# Altium schematic sheet FR3068E-C_MCU_DEV1.4.SchDoc
size A3; SheetNumber: 1; SheetTotal: 3
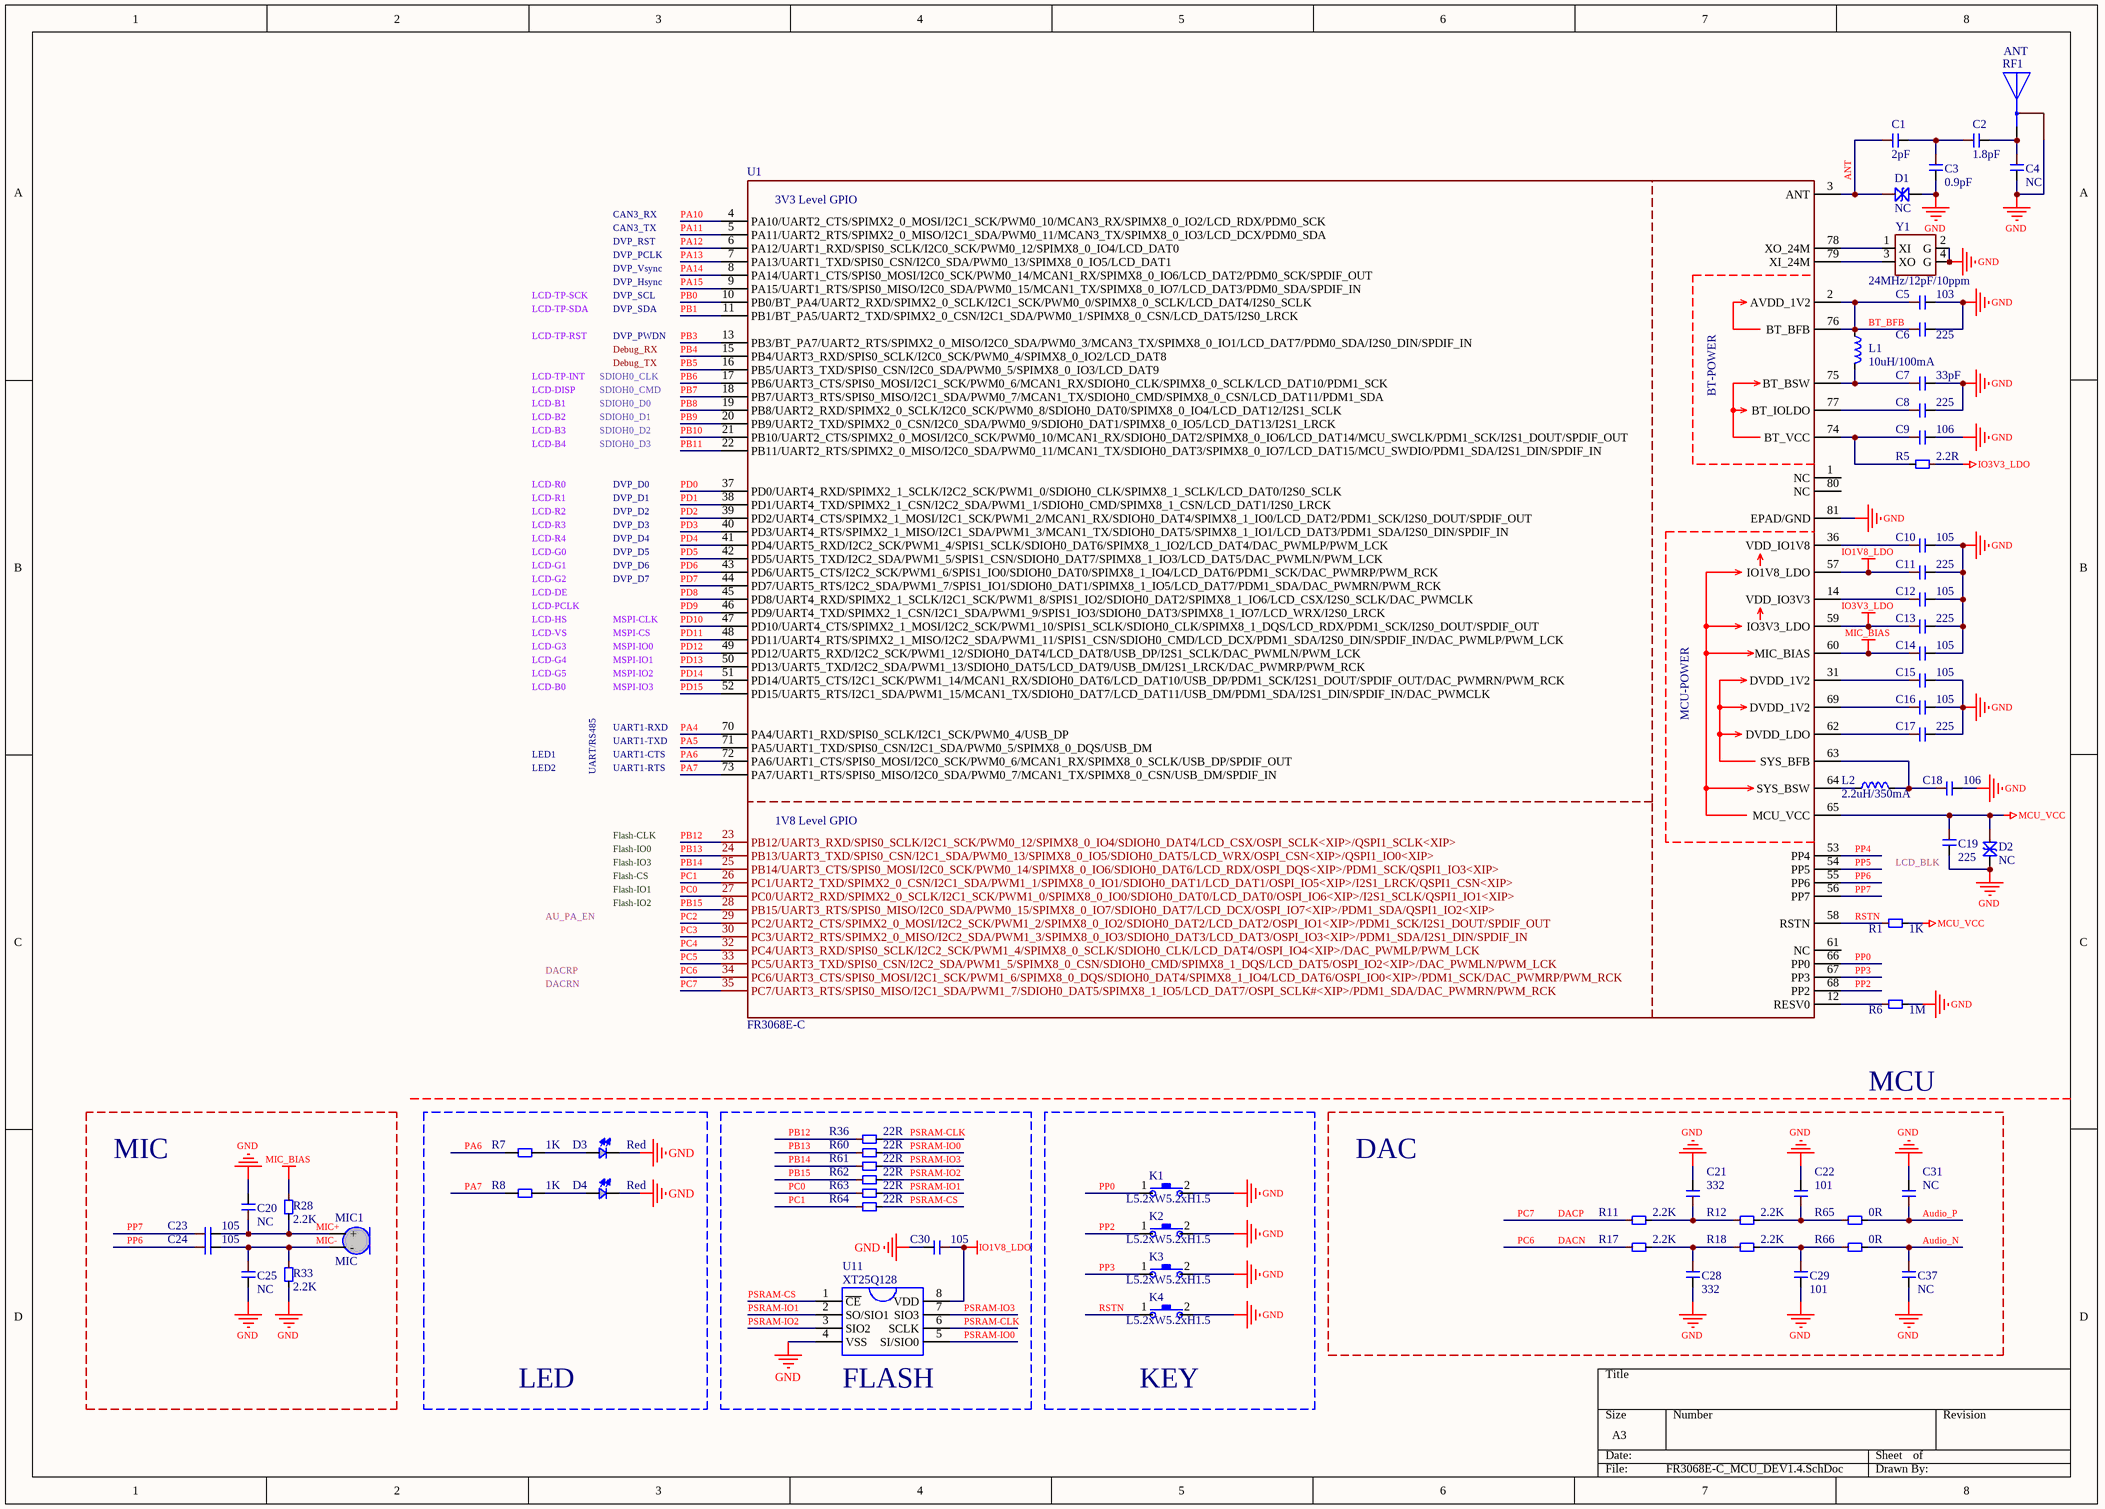
[diagram p0: FR3068E-C_MCU_DEV1.4.SchDoc]

## Parts
C1  2pF  [C0402]
C2  1.8pF  [C0402]
C3  0.9pF  [C0402]
C4  NC  [C0402]
C5  103  [C0402]
C6  225  [C0402]
C7  33pF  [C0402]
C8  225  [C0402]
C9  106  [C0603]
C10  105  [C0402]
C11  225  [C0402]
C12  105  [C0402]
C13  225  [C0402]
C14  105  [C0402]
C15  105  [C0402]
C16  105  [C0402]
C17  225  [C0402]
C18  106  [C0603]
C19  225  [C0402]
C20  NC  [C0402]
C21  332  [C0402]
C22  101  [C0402]
C23  105  [C0402]
C24  105  [C0402]
C25  NC  [C0402]
C28  332  [C0402]
C29  101  [C0402]
C30  105  [C0402]
C31  NC  [C0402]
C37  NC  [C0402]
D1  NC  [R0402]
D2  NC  [SOD-323A]
D3  Red  [D0603]
D4  Red  [D0603]
K1  L5.2xW5.2xH1.5  [TS-030 5.2*5.2mm]
K2  L5.2xW5.2xH1.5  [TS-030 5.2*5.2mm]
K3  L5.2xW5.2xH1.5  [TS-030 5.2*5.2mm]
K4  L5.2xW5.2xH1.5  [TS-030 5.2*5.2mm]
L1  10uH/100mA  [L0603]
L2  2.2uH/350mA  [L0603]
MIC1  MIC  [MIC4013SMT]
R1  1K  [R0402]
R5  2.2R  [R0603]
R6  1M  [R0402]
R7  1K  [R0402]
R8  1K  [R0402]
R11  2.2K  [R0402]
R12  2.2K  [R0402]
R17  2.2K  [R0402]
R18  2.2K  [R0402]
R28  2.2K  [R0402]
R33  2.2K  [R0402]
R36  22R  [R0402]
R60  22R  [R0402]
R61  22R  [R0402]
R62  22R  [R0402]
R63  22R  [R0402]
R64  22R  [R0402]
R65  0R  [R0402]
R66  0R  [R0402]
RF1  ANT  [RFA]
U1  FR3068E-C  [QFN80_0909_P0.4]
U11  XT25Q128  [WSON8_6X5MM]
Y1  24MHz/12pF/10ppm  [CRY3225_4P]

## Blocks framed on the sheet
MIC: C20 C23-C25 MIC1 R28 R33
LED: D3 D4 R7 R8
FLASH: C30 R36 R60-R64 U11
KEY: K1-K4

## Nets
GND: C3.1 C4.1 C5.1 C6.1 C7.1 C8.1 C9.1 C10.1 C11.1 C12.1 C13.1 C14.1 C15.1 C16.1 C17.1 C18.1 C19.1 C20.1 C21.1 C22.1 C25.1 C28.1 C29.1 C30.1 C31.1 C37.1 D1.1 D2.1 D3.2 D4.2 K1.2 K2.2 K3.2 K4.2 R6.1 R33.1 RF1.2 U1.81(EPAD/GND) U11.4(VSS) Y1.2(G) Y1.4(G)
IO1V8_LDO: C11.2 C30.2 U1.57(IO1V8_LDO) U11.8(VDD)
IO3V3_LDO: C13.2 R5.2 U1.59(IO3V3_LDO)
MCU_VCC: C19.2 D2.2 R1.1 U1.65(MCU_VCC)
MIC_BIAS: C14.2 R28.2 U1.60(MIC_BIAS)
ANT: C1.2 D1.2 U1.3(ANT)
Audio_N: C37.2 R66.1
Audio_P: C31.2 R65.1
BT_BFB: C5.2 C6.2 L1.1 U1.2(AVDD_1V2) U1.76(BT_BFB)
DACN: R17.2 U1.34(PC6/UART3_CTS/SPIS0_MOSI/I2C1_SCK/PWM1_6/SPIMX8_0_DQS/SDIOH0_DAT4/SPIMX8_1_IO4/LCD_DAT6/OSPI_IO0<XIP>/PDM1_SCK/DAC_PWMRP/PWM_RCK)  [also labelled PC6]
DACP: R11.2 U1.35(PC7/UART3_RTS/SPIS0_MISO/I2C1_SDA/PWM1_7/SDIOH0_DAT5/SPIMX8_1_IO5/LCD_DAT7/OSPI_SCLK#<XIP>/PDM1_SDA/DAC_PWMRN/PWM_RCK)  [also labelled PC7]
MIC+: C20.2 C23.1 MIC1.1(+) R28.1
MIC-: C24.1 C25.2 MIC1.2(-) R33.2
PA4: U1.70(PA4/UART1_RXD/SPIS0_SCLK/I2C1_SCK/PWM0_4/USB_DP)
PA5: U1.71(PA5/UART1_TXD/SPIS0_CSN/I2C1_SDA/PWM0_5/SPIMX8_0_DQS/USB_DM)
PA6: R7.2 U1.72(PA6/UART1_CTS/SPIS0_MOSI/I2C0_SCK/PWM0_6/MCAN1_RX/SPIMX8_0_SCLK/USB_DP/SPDIF_OUT)
PA7: R8.2 U1.73(PA7/UART1_RTS/SPIS0_MISO/I2C0_SDA/PWM0_7/MCAN1_TX/SPIMX8_0_CSN/USB_DM/SPDIF_IN)
PA10: U1.4(PA10/UART2_CTS/SPIMX2_0_MOSI/I2C1_SCK/PWM0_10/MCAN3_RX/SPIMX8_0_IO2/LCD_RDX/PDM0_SCK)
PA11: U1.5(PA11/UART2_RTS/SPIMX2_0_MISO/I2C1_SDA/PWM0_11/MCAN3_TX/SPIMX8_0_IO3/LCD_DCX/PDM0_SDA)
PA12: U1.6(PA12/UART1_RXD/SPIS0_SCLK/I2C0_SCK/PWM0_12/SPIMX8_0_IO4/LCD_DAT0)
PA13: U1.7(PA13/UART1_TXD/SPIS0_CSN/I2C0_SDA/PWM0_13/SPIMX8_0_IO5/LCD_DAT1)
PA14: U1.8(PA14/UART1_CTS/SPIS0_MOSI/I2C0_SCK/PWM0_14/MCAN1_RX/SPIMX8_0_IO6/LCD_DAT2/PDM0_SCK/SPDIF_OUT)
PA15: U1.9(PA15/UART1_RTS/SPIS0_MISO/I2C0_SDA/PWM0_15/MCAN1_TX/SPIMX8_0_IO7/LCD_DAT3/PDM0_SDA/SPDIF_IN)
PB0: U1.10(PB0/BT_PA4/UART2_RXD/SPIMX2_0_SCLK/I2C1_SCK/PWM0_0/SPIMX8_0_SCLK/LCD_DAT4/I2S0_SCLK)
PB1: U1.11(PB1/BT_PA5/UART2_TXD/SPIMX2_0_CSN/I2C1_SDA/PWM0_1/SPIMX8_0_CSN/LCD_DAT5/I2S0_LRCK)
PB3: U1.13(PB3/BT_PA7/UART2_RTS/SPIMX2_0_MISO/I2C0_SDA/PWM0_3/MCAN3_TX/SPIMX8_0_IO1/LCD_DAT7/PDM0_SDA/I2S0_DIN/SPDIF_IN)
PB4: U1.15(PB4/UART3_RXD/SPIS0_SCLK/I2C0_SCK/PWM0_4/SPIMX8_0_IO2/LCD_DAT8)
PB5: U1.16(PB5/UART3_TXD/SPIS0_CSN/I2C0_SDA/PWM0_5/SPIMX8_0_IO3/LCD_DAT9)
PB6: U1.17(PB6/UART3_CTS/SPIS0_MOSI/I2C1_SCK/PWM0_6/MCAN1_RX/SDIOH0_CLK/SPIMX8_0_SCLK/LCD_DAT10/PDM1_SCK)
PB7: U1.18(PB7/UART3_RTS/SPIS0_MISO/I2C1_SDA/PWM0_7/MCAN1_TX/SDIOH0_CMD/SPIMX8_0_CSN/LCD_DAT11/PDM1_SDA)
PB8: U1.19(PB8/UART2_RXD/SPIMX2_0_SCLK/I2C0_SCK/PWM0_8/SDIOH0_DAT0/SPIMX8_0_IO4/LCD_DAT12/I2S1_SCLK)
PB9: U1.20(PB9/UART2_TXD/SPIMX2_0_CSN/I2C0_SDA/PWM0_9/SDIOH0_DAT1/SPIMX8_0_IO5/LCD_DAT13/I2S1_LRCK)
PB10: U1.21(PB10/UART2_CTS/SPIMX2_0_MOSI/I2C0_SCK/PWM0_10/MCAN1_RX/SDIOH0_DAT2/SPIMX8_0_IO6/LCD_DAT14/MCU_SWCLK/PDM1_SCK/I2S1_DOUT/SPDIF_OUT)
PB11: U1.22(PB11/UART2_RTS/SPIMX2_0_MISO/I2C0_SDA/PWM0_11/MCAN1_TX/SDIOH0_DAT3/SPIMX8_0_IO7/LCD_DAT15/MCU_SWDIO/PDM1_SDA/I2S1_DIN/SPDIF_IN)
PB12: R36.2 U1.23(PB12/UART3_RXD/SPIS0_SCLK/I2C1_SCK/PWM0_12/SPIMX8_0_IO4/SDIOH0_DAT4/LCD_CSX/OSPI_SCLK<XIP>/QSPI1_SCLK<XIP>)
PB13: R60.2 U1.24(PB13/UART3_TXD/SPIS0_CSN/I2C1_SDA/PWM0_13/SPIMX8_0_IO5/SDIOH0_DAT5/LCD_WRX/OSPI_CSN<XIP>/QSPI1_IO0<XIP>)
PB14: R61.2 U1.25(PB14/UART3_CTS/SPIS0_MOSI/I2C0_SCK/PWM0_14/SPIMX8_0_IO6/SDIOH0_DAT6/LCD_RDX/OSPI_DQS<XIP>/PDM1_SCK/QSPI1_IO3<XIP>)
PB15: R62.2 U1.28(PB15/UART3_RTS/SPIS0_MISO/I2C0_SDA/PWM0_15/SPIMX8_0_IO7/SDIOH0_DAT7/LCD_DCX/OSPI_IO7<XIP>/PDM1_SDA/QSPI1_IO2<XIP>)
PC0: R63.2 U1.27(PC0/UART2_RXD/SPIMX2_0_SCLK/I2C1_SCK/PWM1_0/SPIMX8_0_IO0/SDIOH0_DAT0/LCD_DAT0/OSPI_IO6<XIP>/I2S1_SCLK/QSPI1_IO1<XIP>)
PC1: R64.2 U1.26(PC1/UART2_TXD/SPIMX2_0_CSN/I2C1_SDA/PWM1_1/SPIMX8_0_IO1/SDIOH0_DAT1/LCD_DAT1/OSPI_IO5<XIP>/I2S1_LRCK/QSPI1_CSN<XIP>)
PC2: U1.29(PC2/UART2_CTS/SPIMX2_0_MOSI/I2C2_SCK/PWM1_2/SPIMX8_0_IO2/SDIOH0_DAT2/LCD_DAT2/OSPI_IO1<XIP>/PDM1_SCK/I2S1_DOUT/SPDIF_OUT)
PC3: U1.30(PC3/UART2_RTS/SPIMX2_0_MISO/I2C2_SDA/PWM1_3/SPIMX8_0_IO3/SDIOH0_DAT3/LCD_DAT3/OSPI_IO3<XIP>/PDM1_SDA/I2S1_DIN/SPDIF_IN)
PC4: U1.32(PC4/UART3_RXD/SPIS0_SCLK/I2C2_SCK/PWM1_4/SPIMX8_0_SCLK/SDIOH0_CLK/LCD_DAT4/OSPI_IO4<XIP>/DAC_PWMLP/PWM_LCK)
PC5: U1.33(PC5/UART3_TXD/SPIS0_CSN/I2C2_SDA/PWM1_5/SPIMX8_0_CSN/SDIOH0_CMD/SPIMX8_1_DQS/LCD_DAT5/OSPI_IO2<XIP>/DAC_PWMLN/PWM_LCK)
PD0: U1.37(PD0/UART4_RXD/SPIMX2_1_SCLK/I2C2_SCK/PWM1_0/SDIOH0_CLK/SPIMX8_1_SCLK/LCD_DAT0/I2S0_SCLK)
PD1: U1.38(PD1/UART4_TXD/SPIMX2_1_CSN/I2C2_SDA/PWM1_1/SDIOH0_CMD/SPIMX8_1_CSN/LCD_DAT1/I2S0_LRCK)
PD2: U1.39(PD2/UART4_CTS/SPIMX2_1_MOSI/I2C1_SCK/PWM1_2/MCAN1_RX/SDIOH0_DAT4/SPIMX8_1_IO0/LCD_DAT2/PDM1_SCK/I2S0_DOUT/SPDIF_OUT)
PD3: U1.40(PD3/UART4_RTS/SPIMX2_1_MISO/I2C1_SDA/PWM1_3/MCAN1_TX/SDIOH0_DAT5/SPIMX8_1_IO1/LCD_DAT3/PDM1_SDA/I2S0_DIN/SPDIF_IN)
PD4: U1.41(PD4/UART5_RXD/I2C2_SCK/PWM1_4/SPIS1_SCLK/SDIOH0_DAT6/SPIMX8_1_IO2/LCD_DAT4/DAC_PWMLP/PWM_LCK)
PD5: U1.42(PD5/UART5_TXD/I2C2_SDA/PWM1_5/SPIS1_CSN/SDIOH0_DAT7/SPIMX8_1_IO3/LCD_DAT5/DAC_PWMLN/PWM_LCK)
PD6: U1.43(PD6/UART5_CTS/I2C2_SCK/PWM1_6/SPIS1_IO0/SDIOH0_DAT0/SPIMX8_1_IO4/LCD_DAT6/PDM1_SCK/DAC_PWMRP/PWM_RCK)
PD7: U1.44(PD7/UART5_RTS/I2C2_SDA/PWM1_7/SPIS1_IO1/SDIOH0_DAT1/SPIMX8_1_IO5/LCD_DAT7/PDM1_SDA/DAC_PWMRN/PWM_RCK)
PD8: U1.45(PD8/UART4_RXD/SPIMX2_1_SCLK/I2C1_SCK/PWM1_8/SPIS1_IO2/SDIOH0_DAT2/SPIMX8_1_IO6/LCD_CSX/I2S0_SCLK/DAC_PWMCLK)
PD9: U1.46(PD9/UART4_TXD/SPIMX2_1_CSN/I2C1_SDA/PWM1_9/SPIS1_IO3/SDIOH0_DAT3/SPIMX8_1_IO7/LCD_WRX/I2S0_LRCK)
PD10: U1.47(PD10/UART4_CTS/SPIMX2_1_MOSI/I2C2_SCK/PWM1_10/SPIS1_SCLK/SDIOH0_CLK/SPIMX8_1_DQS/LCD_RDX/PDM1_SCK/I2S0_DOUT/SPDIF_OUT)
PD11: U1.48(PD11/UART4_RTS/SPIMX2_1_MISO/I2C2_SDA/PWM1_11/SPIS1_CSN/SDIOH0_CMD/LCD_DCX/PDM1_SDA/I2S0_DIN/SPDIF_IN/DAC_PWMLP/PWM_LCK)
PD12: U1.49(PD12/UART5_RXD/I2C2_SCK/PWM1_12/SDIOH0_DAT4/LCD_DAT8/USB_DP/I2S1_SCLK/DAC_PWMLN/PWM_LCK)
PD13: U1.50(PD13/UART5_TXD/I2C2_SDA/PWM1_13/SDIOH0_DAT5/LCD_DAT9/USB_DM/I2S1_LRCK/DAC_PWMRP/PWM_RCK)
PD14: U1.51(PD14/UART5_CTS/I2C1_SCK/PWM1_14/MCAN1_RX/SDIOH0_DAT6/LCD_DAT10/USB_DP/PDM1_SCK/I2S1_DOUT/SPDIF_OUT/DAC_PWMRN/PWM_RCK)
PD15: U1.52(PD15/UART5_RTS/I2C1_SDA/PWM1_15/MCAN1_TX/SDIOH0_DAT7/LCD_DAT11/USB_DM/PDM1_SDA/I2S1_DIN/SPDIF_IN/DAC_PWMCLK)
PP0: K1.1 U1.66(PP0)
PP2: K2.1 U1.68(PP2)
PP3: K3.1 U1.67(PP3)
PP4: U1.53(PP4)
PP5: U1.54(PP5)
PP6: C24.2 U1.55(PP6)
PP7: C23.2 U1.56(PP7)
PSRAM-CLK: R36.1 U11.6(SCLK)
PSRAM-CS: R64.1 U11.1(~{CE})
PSRAM-IO0: R60.1 U11.5(SI/SIO0)
PSRAM-IO1: R63.1 U11.2(SO/SIO1)
PSRAM-IO2: R62.1 U11.3(SIO2)
PSRAM-IO3: R61.1 U11.7(SIO3)
RSTN: K4.1 R1.2 U1.58(RSTN)
NetC1_1: C1.1 C2.2 C3.2
NetC2_1: C2.1 C4.2 RF1.1
NetC7_2: C7.2 L1.2 U1.75(BT_BSW)
NetC8_2: C8.2 U1.77(BT_IOLDO)
NetC9_2: C9.2 R5.1 U1.74(BT_VCC)
NetC10_2: C10.2 U1.36(VDD_IO1V8)
NetC12_2: C12.2 U1.14(VDD_IO3V3)
NetC15_2: C15.2 U1.31(DVDD_1V2)
NetC16_2: C16.2 U1.69(DVDD_1V2)
NetC17_2: C17.2 U1.62(DVDD_LDO)
NetC18_2: C18.2 L2.1 U1.63(SYS_BFB)
NetC21_2: C21.2 R11.1 R12.2
NetC22_2: C22.2 R12.1 R65.2
NetC28_2: C28.2 R17.1 R18.2
NetC29_2: C29.2 R18.1 R66.2
NetD3_1: D3.1 R7.1
NetD4_1: D4.1 R8.1
NetL2_2: L2.2 U1.64(SYS_BSW)
NetR6_2: R6.2 U1.12(RESV0)
NetU1_78: U1.78(XO_24M) Y1.1(XI)
NetU1_79: U1.79(XI_24M) Y1.3(XO)

Not connected (* = marked no-connect by the designer): U1 1(NC) 61(NC) 80(NC)

## Notes on the sheet
- CAN3_TX
- CAN3_RX
- DVP_RST
- LCD-TP-SDA
- LCD-TP-SCK
- DVP_PCLK
- DVP_Vsync
- DVP_Hsync
- DVP_SCL
- DVP_SDA
- LCD-TP-RST
- LCD-TP-INT
- SDIOH0_CLK
- Debug_RX
- Debug_TX
- DVP_PWDN
- LCD-DISP
- LCD-B1
- LCD-B2
- LCD-B3
- LCD-B4
- SDIOH0_D0
- SDIOH0_CMD
- SDIOH0_D1
- SDIOH0_D2
- SDIOH0_D3
- LCD-R0
- LCD-R1
- LCD-R2
- DVP_D0
- DVP_D1
- DVP_D2
- LCD-G1
- LCD-G2
- LCD-R3
- LCD-R4
- LCD-G0
- DVP_D3
- DVP_D4
- DVP_D5
- DVP_D6
- DVP_D7
- LCD-VS
- LCD-HS
- LCD-PCLK
- LCD-DE
- LCD-G3
- MSPI-CLK
- MSPI-CS
- MSPI-IO0
- LCD-G4
- LCD-G5
- LCD-B0
- MSPI-IO1
- MSPI-IO2
- MSPI-IO3
- LED1
- LED2
- UART/RS485
- UART1-RXD
- UART1-TXD
- UART1-CTS
- UART1-RTS
- Flash-CLK
- Flash-IO0
- AU_PA_EN
- Flash-CS
- Flash-IO1
- Flash-IO2
- Flash-IO3
- (near C19) LCD_BLK
- DACRP
- DACRN
- MCU
- DAC
- (in symbol FR3068E_C) 3V3 Level GPIO; BT-POWER; MCU-POWER; 1V8 Level GPIO

## Library data of the parts
C1-C25 C28-C31 C37 = C: PartName: 贴片电容
D1 D2 = TVS
D3 D4 = LED
K1-K4 = SW(TS-030)
L1 L2 = L
R1 R5-R8 R11 R12 R17 R18 R28 R33 R36 R60-R66 = R
RF1 = RFANT_BT
U1 = FR3068E_C: QFN80_0909_P0.4
U11 = PSRAM
Y1 = CRY3225